# Altium schematic sheet Power.SchDoc
size A4
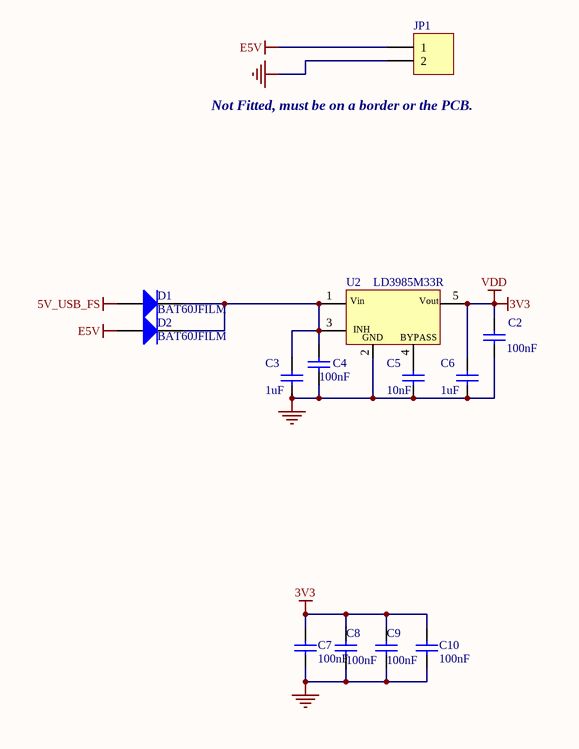
[diagram p0: Power.SchDoc]

## Parts
C2  100nF  [0603]
C3  1uF  [0603]
C4  100nF  [0603]
C5  10nF  [0603]
C6  1uF  [0603]
C7  100nF  [0603]
C8  100nF  [0603]
C9  100nF  [0603]
C10  100nF  [0603]
D1  BAT60JFILM  [BAT60JFILM]
D2  BAT60JFILM  [BAT60JFILM]
JP1  Header 2  [HDR1X2]  (value not drawn)
U2  LD3985M33R  [LD3985M33R]

## Nets
3V3: C2.2 C6.1 C7.1 C8.2 C9.1 C10.1 U2.5(Vout)  [also labelled VDD]
5V_USB_FS: D1.1(A)
E5V: D2.1(A) JP1.1
GND: C2.1 C3.1 C4.1 C5.1 C6.2 C7.2 C8.1 C9.2 C10.2 JP1.2 U2.2(GND)
NetC3_2: C3.2 C4.2 D1.2(K) D2.2(K) U2.1(Vin) U2.3(CE)
NetC5_2: C5.2 U2.4(BYPASS)

## Notes on the sheet
- (near JP1) Not Fitted, must be on a border or the PCB.
- (in symbol LD3985M33R) INH

## Library data of the parts
C2 C4 C7-C10 = Cap_100nF_X7R_10%_0402: 0201; Manuf_Part_1: CC0402KRX7R7BB104; Manuf_1: YAGEO; Revision: July-2002: Re-released for DXP Platform.; Value: 100nF; Order: CC0402KRX7R7BB104
C3 C6 = Cap_1uF_X5R_10%_0603: 0201; Manuf_Part_1: CC0603KRX5R7BB105; Manuf_1: YAGEO; Revision: July-2002: Re-released for DXP Platform.; Value: 1uF; Order: CC0603KRX5R7BB105
C5 = Cap_10nF_X7R_10%_0603: 0201; Manuf_Part_1: CC0603KRX7R9BB103; Manuf_1: YAGEO; Revision: July-2002: Re-released for DXP Platform.; Value: 10nF; Order: CC0603KRX7R9BB103
D1 D2 = BAT60JFILM: Manuf_1: STM; Provided: ST; ECCN_US/EU: EAR99/NEC; Ref St: 9151097; Revision: July-2002: Re-released for DXP Platform.; Order: BAT60JFILM; Manuf_Part_1: BAT60JFILM; Distrib: ST
JP1 = Header 2: Header, 2-Pin; LatestRevisionDate: 17-Jul-2002; LatestRevisionNote: Re-released for DXP Platform.; Publisher: Altium Limited
U2 = LD3985M33R: Ultra low drop-low noise BiCMOS voltage, regulators low ESR capacitors compatible; Manuf_1: STM; Provided: ST; Ref St: 9176161; ECCN_US/EU: EAR99/NEC; Manuf_Part_1: LD3985M33R; Distrib: ST; Order: LD3985M33R